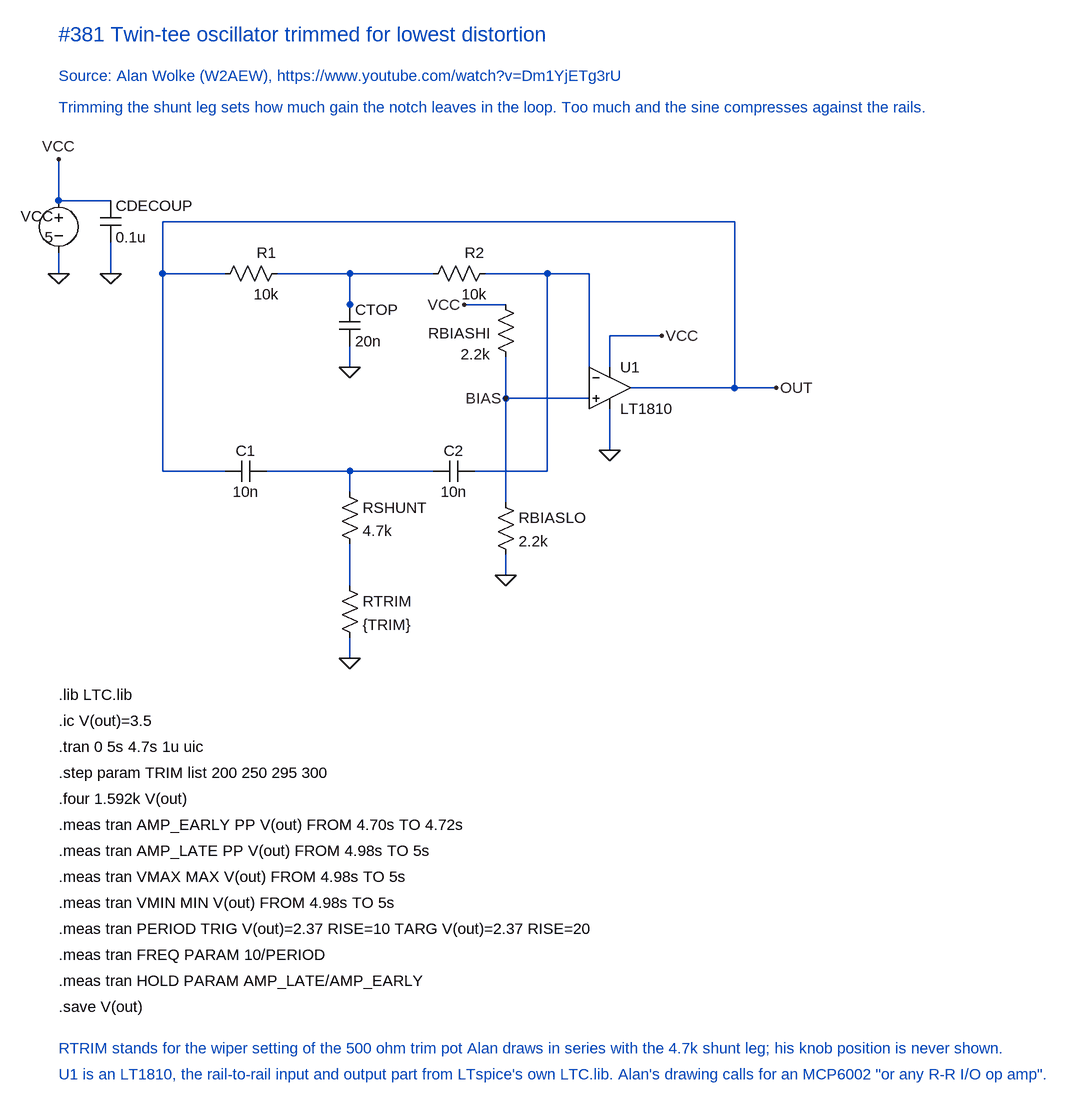
[diagram p0: schematic Twin-tee oscillator distortion trim.asc]
Twin-tee oscillator distortion trim.asc, the LTspice schematic file:
Version 4
SHEET 1 2400 1600
WIRE 320 208 1200 208
WIRE 320 288 320 208
WIRE 416 288 320 288
WIRE 608 288 496 288
WIRE 736 288 608 288
WIRE 976 288 816 288
WIRE 976 288 976 448
WIRE 912 592 912 288
WIRE 1040 464 1200 464
WIRE 1200 464 1200 208
WIRE 1264 464 1200 464
WIRE 320 592 320 288
WIRE 416 592 320 592
WIRE 608 592 480 592
WIRE 736 592 608 592
WIRE 912 592 800 592
WIRE 608 352 608 288
WIRE 608 432 608 400
WIRE 608 624 608 592
WIRE 608 768 608 704
WIRE 608 880 608 848
WIRE 784 336 848 336
WIRE 848 416 848 432
WIRE 848 432 848 480
WIRE 848 480 976 480
WIRE 848 640 848 480
WIRE 848 752 848 720
WIRE 1008 384 1008 432
WIRE 1008 384 1088 384
WIRE 1008 496 1008 560
WIRE 160 112 160 176
WIRE 160 176 240 176
WIRE 160 256 160 288
WIRE 240 240 240 288
FLAG 608 432 0
FLAG 608 880 0
FLAG 784 336 VCC
FLAG 848 752 0
FLAG 1088 384 VCC
FLAG 1008 560 0
FLAG 1264 464 OUT
FLAG 160 112 VCC
FLAG 160 288 0
FLAG 240 288 0
FLAG 848 480 BIAS
SYMBOL voltage 160 160 R0
WINDOW 0 -8 40 Right 2
WINDOW 3 -8 72 Right 2
SYMATTR InstName VCC
SYMATTR Value 5
SYMBOL cap 224 176 R0
SYMATTR InstName CDECOUP
SYMATTR Value 0.1u
SYMBOL res 512 272 R90
WINDOW 0 0 32 VBottom 2
WINDOW 3 32 32 VTop 2
SYMATTR InstName R1
SYMATTR Value 10k
SYMBOL res 832 272 R90
WINDOW 0 0 32 VBottom 2
WINDOW 3 32 32 VTop 2
SYMATTR InstName R2
SYMATTR Value 10k
SYMBOL cap 592 336 R0
SYMATTR InstName CTOP
SYMATTR Value 20n
SYMBOL cap 480 576 R90
WINDOW 0 0 32 VBottom 2
WINDOW 3 32 32 VTop 2
SYMATTR InstName C1
SYMATTR Value 10n
SYMBOL cap 800 576 R90
WINDOW 0 0 32 VBottom 2
WINDOW 3 32 32 VTop 2
SYMATTR InstName C2
SYMATTR Value 10n
SYMBOL res 592 608 R0
SYMATTR InstName RSHUNT
SYMATTR Value 4.7k
SYMBOL res 592 752 R0
SYMATTR InstName RTRIM
SYMATTR Value {TRIM}
SYMBOL res 832 320 R0
WINDOW 0 -8 60 Right 2
WINDOW 3 -8 92 Right 2
SYMATTR InstName RBIASHI
SYMATTR Value 2.2k
SYMBOL res 832 624 R0
SYMATTR InstName RBIASLO
SYMATTR Value 2.2k
SYMBOL Opamps\opamp2 1008 400 R0
SYMATTR InstName U1
SYMATTR Value LT1810
TEXT 160 -80 Left 3 ;#381 Twin-tee oscillator trimmed for lowest distortion
TEXT 160 -16 Left 2 ;Source: Alan Wolke (W2AEW), https://www.youtube.com/watch?v=Dm1YjETg3rU
TEXT 160 32 Left 2 ;Trimming the shunt leg sets how much gain the notch leaves in the loop. Too much and the sine compresses against the rails.
TEXT 160 936 Left 2 !.lib LTC.lib
TEXT 160 976 Left 2 !.ic V(out)=3.5
TEXT 160 1016 Left 2 !.tran 0 5s 4.7s 1u uic
TEXT 160 1056 Left 2 !.step param TRIM list 200 250 295 300
TEXT 160 1096 Left 2 !.four 1.592k V(out)
TEXT 160 1136 Left 2 !.meas tran AMP_EARLY PP V(out) FROM 4.70s TO 4.72s
TEXT 160 1176 Left 2 !.meas tran AMP_LATE PP V(out) FROM 4.98s TO 5s
TEXT 160 1216 Left 2 !.meas tran VMAX MAX V(out) FROM 4.98s TO 5s
TEXT 160 1256 Left 2 !.meas tran VMIN MIN V(out) FROM 4.98s TO 5s
TEXT 160 1296 Left 2 !.meas tran PERIOD TRIG V(out)=2.37 RISE=10 TARG V(out)=2.37 RISE=20
TEXT 160 1336 Left 2 !.meas tran FREQ PARAM 10/PERIOD
TEXT 160 1376 Left 2 !.meas tran HOLD PARAM AMP_LATE/AMP_EARLY
TEXT 160 1416 Left 2 !.save V(out)
TEXT 160 1480 Left 2 ;RTRIM stands for the wiper setting of the 500 ohm trim pot Alan draws in series with the 4.7k shunt leg; his knob position is never shown.
TEXT 160 1520 Left 2 ;U1 is an LT1810, the rail-to-rail input and output part from LTspice's own LTC.lib. Alan's drawing calls for an MCP6002 "or any R-R I/O op amp".

The netlist it stands for:
* Twin-tee oscillator distortion trim.asc
VCC VCC 0 5
CDECOUP VCC 0 0.1u
R1 N001 OUT 10k
R2 N002 N001 10k
CTOP N001 0 20n
C1 N003 OUT 10n
C2 N002 N003 10n
RSHUNT N003 N004 4.7k
RTRIM N004 0 {TRIM}
RBIASHI VCC BIAS 2.2k
RBIASLO BIAS 0 2.2k
XU1 BIAS N002 VCC 0 OUT LT1810  ; pins In+ In- V+ V- OUT
* #381 Twin-tee oscillator trimmed for lowest distortion
* Source: Alan Wolke (W2AEW), https://www.youtube.com/watch?v=Dm1YjETg3rU
* Trimming the shunt leg sets how much gain the notch leaves in the loop. Too much and the sine compresses against the rails.
.lib LTC.lib
.ic V(out)=3.5
.tran 0 5s 4.7s 1u uic
.step param TRIM list 200 250 295 300
.four 1.592k V(out)
.meas tran AMP_EARLY PP V(out) FROM 4.70s TO 4.72s
.meas tran AMP_LATE PP V(out) FROM 4.98s TO 5s
.meas tran VMAX MAX V(out) FROM 4.98s TO 5s
.meas tran VMIN MIN V(out) FROM 4.98s TO 5s
.meas tran PERIOD TRIG V(out)=2.37 RISE=10 TARG V(out)=2.37 RISE=20
.meas tran FREQ PARAM 10/PERIOD
.meas tran HOLD PARAM AMP_LATE/AMP_EARLY
.save V(out)
* RTRIM stands for the wiper setting of the 500 ohm trim pot Alan draws in series with the 4.7k shunt leg; his knob position is never shown.
* U1 is an LT1810, the rail-to-rail input and output part from LTspice's own LTC.lib. Alan's drawing calls for an MCP6002 "or any R-R I/O op amp".
.backanno
.end